# Altium project Board1.PrjPcb
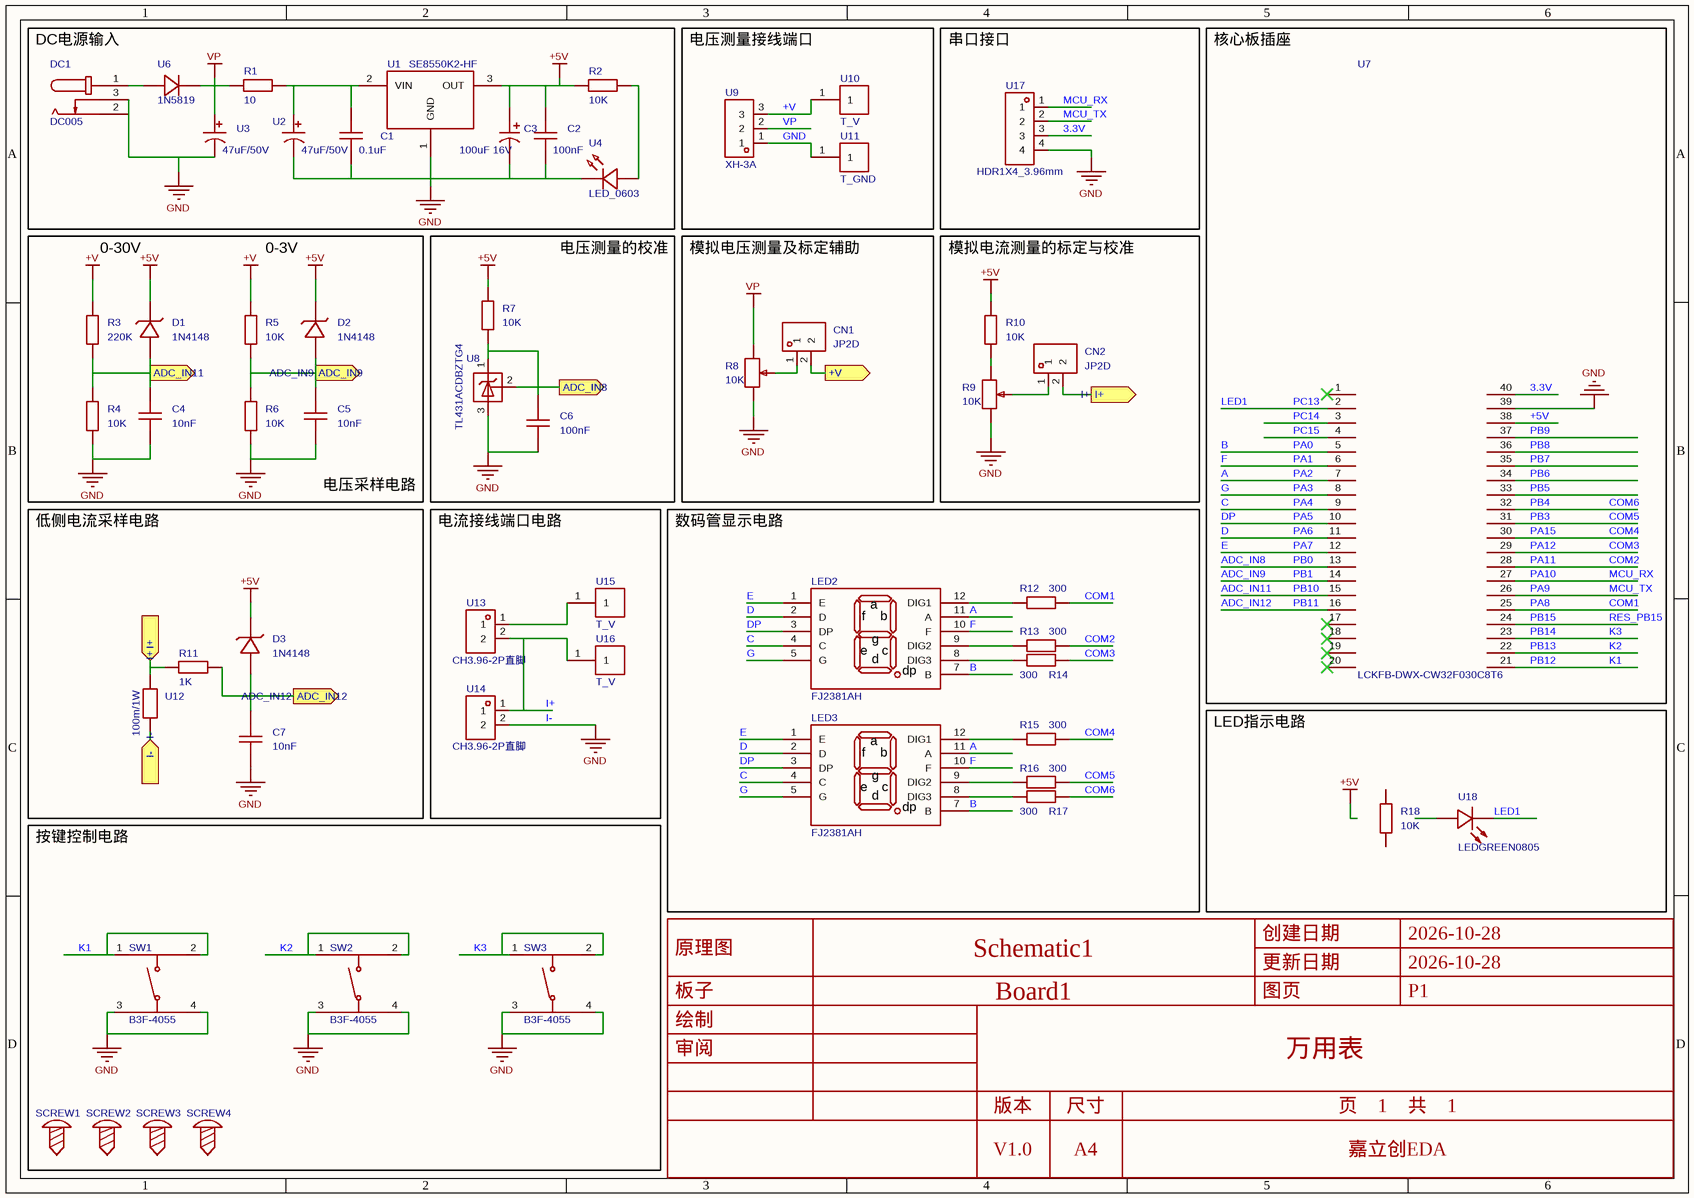
[diagram p0: P1.schdoc]
1 sheet, 57 parts. Net scope: flat (ports and power ports of the same name join across sheets).
Board file: PCB1.pcbdoc

## Sheet P1.schdoc
size 297 x 209 mm; Symbol: Drawing-Symbol_A4; Device: Drawing-Symbol_A4; Company: 嘉立创EDA; Version: V1.0; Page Size: A4; @Project Name: 万用表; @Update Date: 2026-10-28; @Create Date: 2026-10-28; @Board Name: Board1; @Page Name: P1; @Create Time: 20:47:09; @Page Count: 1; @Page No: 1; @Schematic Name: Schematic1; @Update Time: 20:47:09; @Assembly Variant: Basic; Border: 1; Title Block Position: 3; Size: A4; Width: 1170; Height: 825; Region Start: 1; X Region Count: 6; Y Region Count: 4; Blade Width: 10

### Parts
C1  0.1uF  [C0603]
C2  100nF  [C0603]
C3  100uF 16V  [CAP-SMD_L6.0-W3.2-FD]
C4  10nF  [C0603]
C5  10nF  [C0603]
C6  100nF  [C0603]
C7  10nF  [C0603]
CN1  JP2D  [CONN-TH_2P-P3.96-V]
CN2  JP2D  [CONN-TH_2P-P3.96-V]
D1  1N4148  [SOD-123_L2.7-W1.7-LS3.8-RD]
D2  1N4148  [SOD-123_L2.7-W1.7-LS3.8-RD]
D3  1N4148  [SOD-123_L2.7-W1.7-LS3.8-RD]
DC1  DC005  [DC-IN-TH_DC005]
LED2  FJ2381AH  [LED-SEG-TH_FJ2381AH]
LED3  FJ2381AH  [LED-SEG-TH_FJ2381AH]
R1  10  [R0603]
R2  10K  [R0603]
R3  220K  [R0603]
R4  10K  [R0603]
R5  10K  [R0603]
R6  10K  [R0603]
R7  10K  [R0603]
R8  10K  [RES-ADJ-TH_3296W]
R9  10K  [RES-ADJ-TH_3296W]
R10  10K  [R0603]
R11  1K  [R0603]
R12  300  [R0603]
R13  300  [R0603]
R14  300  [R0603]
R15  300  [R0603]
R16  300  [R0603]
R17  300  [R0603]
R18  10K  [R0603]
SCREW1  (no value)  [M2螺丝]
SCREW2  (no value)  [M2螺丝]
SCREW3  (no value)  [M2螺丝]
SCREW4  (no value)  [M2螺丝]
SW1  B3F-4055  [SW-TH_4P-L12.0-W12.0-P5.00-LS12.5]
SW2  B3F-4055  [SW-TH_4P-L12.0-W12.0-P5.00-LS12.5]
SW3  B3F-4055  [SW-TH_4P-L12.0-W12.0-P5.00-LS12.5]
U1  SE8550K2-HF  [SOT-89-3_L4.5-W2.5-P1.50-LS4.2-BR]
U2  47uF/50V  [CAP-TH_BD8.0-P3.50-D0.6-FD-2]
U3  47uF/50V  [CAP-TH_BD8.0-P3.50-D0.6-FD-2]
U4  LED_0603  [LED0603-RD_RED]
U6  1N5819  [SMA_L4.3-W2.6-LS5.1-RD]
U7  LCKFB-DWX-CW32F030C8T6  [DIP-40_L53.34-W15.24-P2.54-LS15.24]
U8  TL431ACDBZTG4  [SOT-23-3_L3.0-W1.7-P0.95-LS2.9-BR]
U9  XH-3A  [CONN-TH_3P-P2.50_C9900023074]
U10  T_V  [TH-1_C9900016725]
U11  T_GND  [TH-1_C9900016725]
U12  100m/1W  [R1206]
U13  CH3.96-2P直脚  [CONN-TH_CH3.96-2P]
U14  CH3.96-2P直脚  [CONN-TH_CH3.96-2P]
U15  T_V  [TH-1_C9900016725]
U16  T_V  [TH-1_C9900016725]
U17  HDR1X4_3.96mm  [CONN-TH_4P-P3.96_FWF39601-S04S22W1B]
U18  LEDGREEN0805  [LED0805-R-RD_GREEN]

### Blocks framed on the sheet
DC电源输入: C1-C3 DC1 R1 R2 U1-U4 U6
电压测量接线端口: U9-U11
串口接口: U17
核心板插座: U7
电压测量的校准: C6 R7 U8
模拟电压测量及标定辅助: CN1 R8
模拟电流测量的标定与校准: CN2 R9 R10
电流接线端口电路: U13-U16
数码管显示电路: LED2 LED3 R12-R17
LED指示电路: R18 U18
按键控制电路: SCREW1-SCREW4 SW1-SW3

### Ports
+V (out), ADC_IN8 (out), ADC_IN9 (out), ADC_IN11 (out), ADC_IN12 (out), I+ (in), I+ (out), I- (in)

### Nets
+5V: C2.2 C3.1 D1.1(K) D2.1(K) D3.1(K) R2.1 R7.2 R10.2 U1.3(OUT) U7.38
+V: R3.2 R5.2 U9.3 U10.1
GND: C1.1 C2.1 C3.2 C4.1 C5.1 C6.1 C7.1 DC1.2 DC1.3 R4.1 R6.1 R8.1 R9.1 SW1.3 SW1.4 SW2.3 SW2.4 SW3.3 SW3.4 U1.1(GND) U2.2 U3.2 U4.1(K) U7.39 U8.3(A) U9.1 U11.1 U12.2 U14.2 U17.4 ; port I-  [also labelled I-]
VP: R1.1 R8.3 U3.1 U6.1(K) U9.2
3.3V: U7.40 U17.3
A: LED2.11(A) LED3.11(A) U7.7  [also labelled PA2]
ADC_IN8: U7.13  [also labelled PB0]
ADC_IN9: C5.2 D2.2(A) R5.1 R6.2 U7.14 ; port ADC_IN9  [also labelled PB1]
ADC_IN11: U7.15  [also labelled PB10]
ADC_IN12: C7.2 D3.2(A) R11.1 U7.16 ; port ADC_IN12  [also labelled PB11]
B: LED2.7(B) LED3.7(B) U7.5  [also labelled PA0]
C: LED2.4(C) LED3.4(C) U7.9  [also labelled PA4]
COM1: R12.1 U7.25  [also labelled PA8]
COM2: R13.1 U7.28  [also labelled PA11]
COM3: R14.1 U7.29  [also labelled PA12]
COM4: R15.1 U7.30  [also labelled PA15]
COM5: R16.1 U7.31  [also labelled PB3]
COM6: R17.1 U7.32  [also labelled PB4]
D: LED2.2(D) LED3.2(D) U7.11  [also labelled PA6]
DP: LED2.3(DP) LED3.3(DP) U7.10  [also labelled PA5]
E: LED2.1(E) LED3.1(E) U7.12  [also labelled PA7]
F: LED2.10(F) LED3.10(F) U7.6  [also labelled PA1]
G: LED2.5(G) LED3.5(G) U7.8  [also labelled PA3]
I+: CN2.2 R11.2 U12.1 U13.2 U14.1 U16.1 ; port I+
K1: SW1.1 SW1.2 U7.21  [also labelled PB12]
K2: SW2.1 SW2.2 U7.22  [also labelled PB13]
K3: SW3.1 SW3.2 U7.23  [also labelled PB14]
LED1: U7.2 U18.2(K)  [also labelled PC13]
MCU_RX: U7.27 U17.1  [also labelled PA10]
MCU_TX: U7.26 U17.2  [also labelled PA9]
PB5: U7.33
PB6: U7.34
PB7: U7.35
PB8: U7.36
PB9: U7.37
PB15: U7.24  [also labelled RES_PB15]
PC14: U7.3
PC15: U7.4
NetC1_2: C1.2 R1.2 U1.2(VIN) U2.1
NetC4_2: C4.2 D1.2(A) R3.1 R4.2 ; port ADC_IN11
NetC6_2: C6.2 R7.1 U8.1(K) U8.2(R) ; port ADC_IN8
NetCN1_1: CN1.1 R8.2
NetCN1_2: CN1.2 ; port +V
NetCN2_1: CN2.1 R9.2
NetDC1_1: DC1.1 U6.2(A)
NetLED2_8: LED2.8(DIG3) R14.2
NetLED2_9: LED2.9(DIG2) R13.2
NetLED2_12: LED2.12(DIG1) R12.2
NetLED3_8: LED3.8(DIG3) R17.2
NetLED3_9: LED3.9(DIG2) R16.2
NetLED3_12: LED3.12(DIG1) R15.2
NetR2_2: R2.2 U4.2(A)
NetR9_3: R9.3 R10.1
NetU13_1: U13.1 U15.1

Not connected (* = marked no-connect by the designer): R18 1 2; SCREW1 1; SCREW2 1; SCREW3 1; SCREW4 1; U7 1(0)* 17(0)* 18(0)* 19(0)* 20(0)*; U18 1(A)

### Notes on the sheet
- 0-30V
- 0-3V
- (near C5) 电压采样电路
- 低侧电流采样电路
- 创建日期
- 2026-10-28
- 原理图
- 板子
- Schematic1
- Board1
- 更新日期
- 图页
- P1
- 绘制
- 审阅
- 万用表
- 版本
- V1.0
- 尺寸
- A4
- 页    1    共    1
- 嘉立创EDA
- (in symbol FJ2381AH) a; f; b; g; e; c; d; dp

### Library data of the parts
C1 C2 = CAP_0603: Symbol: Capacitance; ConvertToPcb: yes; ModelId: ac125912035d415993ca9572d50418b10819f05c4eef4c71ace90d822a990e87; ModelName: C0603_L1.6-W0.8-H0.8; ModelTransform: 62.992,31.496,0,0,0,0,0,0,0; Device: CAP_0603; FootprintName: C0603; AddInBom: yes; Supplier Footprint: 0603
  C1: Value: 0.1uF
  C2: Value: 100nF
C3 = 100uF 16V: AddInBom: yes; ModelId: f3109eabdf8740af9f36b97adf252a880819f05c4eef4c71ace90d822a990e87; ModelName: CAP-SMD_L6.0-W3.2-RD; ModelTransform: 237.7948,125.984,0,0,0,0,0,0,0; Symbol: 100UF 16V; Device: 100uF 16V; FootprintName: CAP-SMD_L6.0-W3.2-FD; LCSC Part Name: 100uF 16V; SupplierPart: C9900019364; ManufacturerPart: 100uF 16V; Supplier Footprint: CAP-SMD_6032; JLCPCB Part Class: Extended Part; Supplier: LCSC; ConvertToPcb: yes
C4-C7 = CAP_0603: Symbol: Capacitance; 3D Model: ac125912035d415993ca9572d50418b10819f05c4eef4c71ace90d822a990e87; 3D Model Transform: 62.992,31.496,0,0,0,0,0,0,0; ConvertToPcb: yes; ModelName: C0603_L1.6-W0.8-H0.8; Device: CAP_0603; Supplier Footprint: 0603; FootprintName: C0603; AddInBom: yes
  C4 C5 C7: Value: 10nF
  C6: Value: 100nF
CN1 CN2 = JP2D: AddInBom: yes; ModelId: 2eb2d044c10a453aa78fdaaf8421e3e00819f05c4eef4c71ace90d822a990e87; ModelTransform: 311.8104,334.645,0,0,0,0,0,-23.622,-149.606; Symbol: JP2D; Device: JP2D; FootprintName: CONN-TH_2P-P3.96-V; LCSC Part Name: JP2D; SupplierPart: C9900014930; ManufacturerPart: JP2D; Supplier Footprint: VH3.96; JLCPCB Part Class: Extended Part; Supplier: LCSC; ConvertToPcb: yes; ModelName: CONN-TH_2P-P3.96-V
D1-D3 = 1N4148: Symbol: 1N4148_C9900009645; AddInBom: yes; ModelId: b455d3bf1dad47d3a75f9a76b08071c60819f05c4eef4c71ace90d822a990e87; ModelTransform: 145.669,64.961,0,0,0,0,0,0,0; Device: 1N4148; FootprintName: SOD-123_L2.7-W1.7-LS3.8-RD; LCSC Part Name: 1N4148; SupplierPart: C9900009645; ManufacturerPart: 1N4148; Supplier Footprint: SOD-123_L2.7-W1.7--LS3.8-RD; JLCPCB Part Class: Extended Part; Supplier: LCSC; ConvertToPcb: yes; ModelName: SOD-123_L2.7-W1.7-LS3.8-RD
DC1 = DC005: 连接器类型:DC电源插座;安装方式:弯插;触点内径:2mm;触点外径:6.3mm;额定电流:500mA;额定电压:12V;工作温度:-30℃~+70℃;; Manufacturer: SHOU HAN(首韩); Symbol: DC005_C431533; AddInBom: yes; ModelId: f168fe383f964e0ea2af0127ff6ac7b40819f05c4eef4c71ace90d822a990e87; ModelTransform: 366.141,553.149,0,270,0,0,-141.734,88.583,-149.606; Connector Type: DC电源插座; Inside Contact Diameter: 2mm; Outside Contact Diameter: 6.3mm; Current Rating: 500mA; Voltage Rating (Max): 12V; Body Height: 10.9mm; Device: DC005; FootprintName: DC-IN-TH_DC005; LCSC Part Name: DC电源插座 内径:2mm 外径:6.3mm; SupplierPart: C431533; ManufacturerPart: DC005; Supplier Footprint: 插件; JLCPCB Part Class: Extended Part; Datasheet: https://item.szlcsc.com/datasheet/DC005/427890.html; Supplier: LCSC; ConvertToPcb: yes; ModelName: DC-IN-TH_DC005; Mounting Type: 弯插; Length: 13.6mm; Width: 8.9mm; Operating Temperature: -30℃~+70℃
LED2 LED3 = FJ2381AH: 数码管位数:3位;字符尺寸(英寸):0.28;LED极性:共阴;发光颜色:红色;耗散功率(Pd):-;; Manufacturer: 志浩; AddInBom: yes; ModelId: b22df6d78d6c4251bddd51b739e5becf0819f05c4eef4c71ace90d822a990e87; ModelName: LED-SEG-TH_11P-L22.5-W10.0-H6.1-P2.54-S7.62; ModelTransform: 885.825,393.7,0,0,0,0,0,0,-137.795; Number of Characters: 3位; Digit/Alpha Size(inch): 0.28; Display Type: 7段; LED Polarity: 共阴; Illumination Color: 红色; Symbol: FJ2381AH; Device: FJ2381AH; FootprintName: LED-SEG-TH_FJ2381AH; LCSC Part Name: 3位0.28英寸红色数码管 共阴极; SupplierPart: C10701; ManufacturerPart: FJ2381AH; Supplier Footprint: 插件; JLCPCB Part Class: Extended Part; Datasheet: https://item.szlcsc.com/datasheet/FJ2381AH/11245.html; Supplier: LCSC; ConvertToPcb: yes; Light Intensity: -; Forward Voltage Drop: -; Pd - Power Dissipation: -; Operating Temperature: -; Length: 22.53mm; Width: 10mm; Height: 6.1mm
R1 R2 = Res_0603: Symbol: 电阻; ConvertToPcb: yes; ModelId: fc143cca1e79419f9cd78b61e9279f080819f05c4eef4c71ace90d822a990e87; ModelTransform: 31.8897,63.7794,0,90,0,0,0,0,0; Device: Res_0603; FootprintName: R0603; AddInBom: yes; Supplier Footprint: 0603; ModelName: R0603
  R1: Value: 10
  R2: Value: 10K
R3-R7 R10-R18 = Res_0603: Symbol: 电阻; 3D Model: fc143cca1e79419f9cd78b61e9279f080819f05c4eef4c71ace90d822a990e87; 3D Model Transform: 31.8897,63.7794,0,90,0,0,0,0,0; ConvertToPcb: yes; Device: Res_0603; Supplier Footprint: 0603; FootprintName: R0603; AddInBom: yes; ModelName: R0603
  R3: Value: 220K
  R4-R7 R10 R18: Value: 10K
  R11: Value: 1K
  R12-R17: Value: 300
R8 R9 = 精密电位器 3296W/50欧姆: 阻值:-;功率:-;; Symbol: Precision potentiometer 3296W/50ohm; AddInBom: yes; ModelId: 3664f7b541aa4725a8b6d3b7a961f0780819f05c4eef4c71ace90d822a990e87; ModelTransform: 374.015,188.976,0,90,0,0,2.362,0.005,-137.795; Device: 精密电位器 3296W/50欧姆; Value: 10K; FootprintName: RES-ADJ-TH_3296W; LCSC Part Name: 50Ω; ManufacturerPart: 精密电位器 3296W/50欧姆; Supplier Footprint: VR-3296W; JLCPCB Part Class: Extended Part; Supplier: LCSC; ConvertToPcb: yes; ModelName: RES-ADJ-TH_3296W; Rated Voltage: -; Power(Watts): -; Turns: -
SCREW1-SCREW4 = M2螺丝: Symbol: 螺丝孔; ConvertToPcb: yes; Device: M2螺丝; FootprintName: M2螺丝; AddInBom: yes; Supplier Footprint: 插件
SW1-SW3 = B3F-4055: Symbol: B3F-4055_C9900023790; AddInBom: yes; ModelId: 7313330cfbcf439981db3a700e07703f0819f05c4eef4c71ace90d822a990e87; ModelTransform: 542.968,472.47937,0,0,0,0,0,0.005,-137.795; Device: B3F-4055; FootprintName: SW-TH_4P-L12.0-W12.0-P5.00-LS12.5; LCSC Part Name: B3F-4055; SupplierPart: C9900023790; ManufacturerPart: B3F-4055; Supplier Footprint: B3F-4055轻触开关4脚按键12*12*6; JLCPCB Part Class: Extended Part; Supplier: LCSC; ConvertToPcb: yes; ModelName: SW-TH_4P-L12.0-W12.0-P5.00-LS12.5
U1 = SE8550K2-HF: 输出极性:正极;工作电压:35V;输出电压:5V;输出电流:200mA;电源纹波抑制比(PSRR):80dB;输出类型:固定;; Manufacturer: SEAWARD(思旺); Symbol: SE8550-HF; AddInBom: yes; ModelId: 6db690b7897d4d18a30d90c1b89525ee0819f05c4eef4c71ace90d822a990e87; ModelName: SOT-89-3_L4.3-W2.5-H1.6-LS4.1-P1.50; ModelTransform: 161.417,169.291,0,180,0,0,-18.661,0,0; Output Configuration: 正极; Voltage - Supply: 35V; Output Voltage: 5V; Output Current: 200mA; Power Supply Rejection Ratio (PSRR): 80dB; Voltage Dropout: 300mV@(100mA); standby current: 2.5uA; Output Type: 固定; Device: SE8550K2-HF; FootprintName: SOT-89-3_L4.5-W2.5-P1.50-LS4.2-BR; LCSC Part Name: 5V 200mA 35V; SupplierPart: C115012; ManufacturerPart: SE8550K2-HF; Supplier Footprint: SOT-89-3; JLCPCB Part Class: Extended Part; Datasheet: https://item.szlcsc.com/datasheet/SE8550K2-HF/116256.html; Supplier: LCSC; ConvertToPcb: yes; Noise: -; Features: 输入欠压保护；使能控制；短路保护；热关断; Operating Temperature: -20℃~+85℃; Number of Outputs: -
U2 U3 = 电解电容100uF/50V: AddInBom: yes; ModelId: fd7be3432f664311809e69e3b3557c130819f05c4eef4c71ace90d822a990e87; ModelTransform: 314.96,315.3537,0,90,0,0,0,0,-196.85; Symbol: 电解电容100UF/50V; Device: 电解电容100uF/50V; Manufacturer Part: 47uF/50V; FootprintName: CAP-TH_BD8.0-P3.50-D0.6-FD-2; LCSC Part Name: 电解电容100uF/50V; SupplierPart: C9900023275; Supplier Footprint: CAP-TH_BD8.0-P3.50; JLCPCB Part Class: Extended Part; Supplier: LCSC; ConvertToPcb: yes; ModelName: CAP-TH_BD8.0-P3.50-D0.6-FD-2
U4 = LED_0603: AddInBom: yes; ModelId: 74041d3a270d435c8600a9ab9b7641c00819f05c4eef4c71ace90d822a990e87; ModelTransform: 63.7794,31.496,0,0,0,0,0,-0.002,0; Symbol: LED_0603; Device: LED_0603; FootprintName: LED0603-RD_RED; LCSC Part Name: LED_0603; SupplierPart: C9900015761; ManufacturerPart: LED_0603; Supplier Footprint: LEDRED; JLCPCB Part Class: Extended Part; Supplier: LCSC; ConvertToPcb: yes; ModelName: LED0603-RD_RED
U6 = 1N5819: Symbol: 1N5819_C9900008009; AddInBom: yes; ModelId: 1d20a911e9694ba6aaf6e9207164e4da0819f05c4eef4c71ace90d822a990e87; ModelTransform: 196.4563,102.362,0,0,0,0,0.001,-0.001,0; Device: 1N5819; FootprintName: SMA_L4.3-W2.6-LS5.1-RD; LCSC Part Name: 1N5819; SupplierPart: C9900008009; ManufacturerPart: 1N5819; Supplier Footprint: SMA_L4.3-W2.6-LS5.1-RD; JLCPCB Part Class: Extended Part; Supplier: LCSC; ConvertToPcb: yes; ModelName: SMA_L4.3-W2.6-LS5.1-RD
U7 = LCKFB-DWX-CW32F030C8T6: 搭载Cortex-M0+内核,程序存储容量64KB,RAM总容量8KB,最高64MHz主频,提供高效的计算能力和稳定的运行环境。; Manufacturer: 立创开发板; AddInBom: yes; ModelId: 65c6a085ee334f57b7e20e20cdb6a0820819f05c4eef4c71ace90d822a990e87; ModelTransform: 2114.856,898.9982,0,90,0,0,0,-7.874,-236.22; Symbol: LCKFB-DWX-CW32F030C8T6; Device: LCKFB-DWX-CW32F030C8T6; FootprintName: DIP-40_L53.34-W15.24-P2.54-LS15.24; LCSC Part Name: 立创·地文星-CW32F030C8T6开发板; SupplierPart: C22751548; ManufacturerPart: LCKFB-DWX-CW32F030C8T6; Supplier Footprint: -; JLCPCB Part Class: Extended Part; Datasheet: https://item.szlcsc.com/datasheet/LCKFB-DWX-CW32F030C8T6/24478332.html; Supplier: LCSC; ConvertToPcb: yes; ModelName: DIP-40_L53.34-W15.24-P2.54-LS15.24
U8 = TL431ACDBZTG4: 输出类型:可调;输入电压:-;输出电流:100mA;精度:±1%;; Manufacturer: TI(德州仪器); AddInBom: yes; ModelId: 89cb27a44ab2466697082bb9fd73a7d00819f05c4eef4c71ace90d822a990e87; ModelName: SOT-23-3L_L2.9-W1.6-H1.1-LS2.8-P0.95; ModelTransform: 114.173,110.236,0,90,0,0,0,0,0; Output Type: 可调; Output Current: 100mA; Tolerance: ±1%; Reference Type: 并联; Symbol: TL431ACDBZTG4; Device: TL431ACDBZTG4; FootprintName: SOT-23-3_L3.0-W1.7-P0.95-LS2.9-BR; LCSC Part Name: TL431ACDBZTG4; SupplierPart: C2157219; ManufacturerPart: TL431ACDBZTG4; Supplier Footprint: SOT-23; JLCPCB Part Class: Extended Part; Datasheet: https://www.ti.com/cn/lit/gpn/tl431; Supplier: LCSC; ConvertToPcb: yes; Input Voltage: -; Temperature Coefficient: -; Supply Current: -; Noise - 1/10Hz to 10Hz: -; Noise - 10Hz to 10kHz: -; Operating Temperature: 0℃~+70℃@(Ta)
U9 = XH-3A_C9900023074: AddInBom: yes; ModelId: f64135b5aae74472b0d9f88aaedb98e80819f05c4eef4c71ace90d822a990e87; ModelTransform: 394.094,224.409,0,0,0,0,0,18.661,-118.11; Symbol: XH-3A_C9900023074; Device: XH-3A_C9900023074; FootprintName: CONN-TH_3P-P2.50_C9900023074; LCSC Part Name: XH-3A; SupplierPart: C9900023074; ManufacturerPart: XH-3A; Supplier Footprint: XH2.54-3P; JLCPCB Part Class: Extended Part; Supplier: LCSC; ConvertToPcb: yes; ModelName: CONN-TH_3P-P2.50_C9900023074
U10 U11 U15 U16 = NEW_FOOTPRINT: AddInBom: yes; ModelId: de06a563d2fa4cfb9506e2ac83ef3f720819f05c4eef4c71ace90d822a990e87; ModelTransform: 216.35,236.22004,0,0,0,0,0,-33.465,-98.425; Symbol: NEW_FOOTPRINT; Device: NEW_FOOTPRINT; FootprintName: TH-1_C9900016725; LCSC Part Name: NEW_FOOTPRINT; SupplierPart: C9900016725; Supplier Footprint: NEW_FOOTPRINT; JLCPCB Part Class: Extended Part; Supplier: LCSC; ConvertToPcb: yes; ModelName: TH-1_C9900016725
  U10 U15 U16: Manufacturer Part: T_V
  U11: Manufacturer Part: T_GND
U12 = ARG06BTC2151: AddInBom: yes; ModelId: 89a1f13db2384da588040e0b3c55bf660819f05c4eef4c71ace90d822a990e87; ModelName: R1206_L3.2-W1.6-H0.6; ModelTransform: 125.984,62.992,0,0,0,0,0,0,0; Symbol: ARG06BTC2151; Device: ARG06BTC2151; Manufacturer Part: 100m/1W; FootprintName: R1206; LCSC Part Name: ARG06BTC2151; SupplierPart: C9900151771; Supplier Footprint: R1206; JLCPCB Part Class: Extended Part; Supplier: LCSC; ConvertToPcb: yes
U13 U14 = CH3.96-2P直脚: AddInBom: yes; ModelId: df1c1c596aa749818eee4fbdc34283bf0819f05c4eef4c71ace90d822a990e87; ModelTransform: 314.96,437.401,0,0,0,0,0,0,-137.795; Symbol: CH3.96-2P直脚; Device: CH3.96-2P直脚; FootprintName: CONN-TH_CH3.96-2P; LCSC Part Name: CH3.96-2P直脚; SupplierPart: C9900013003; ManufacturerPart: CH3.96-2P直脚; Supplier Footprint: CON2; JLCPCB Part Class: Extended Part; Supplier: LCSC; ConvertToPcb: yes; ModelName: CONN-TH_CH3.96-2P
U17 = HDR1X4_3.96mm: AddInBom: yes; ModelId: d1971f11994642cab35ac1c5dad2b2580819f05c4eef4c71ace90d822a990e87; ModelTransform: 623.6208,325.1962,0,0,0,0,-0.001,-26.378,-137.795; Symbol: HDR1X4_3.96MM; Device: HDR1X4_3.96mm; FootprintName: CONN-TH_4P-P3.96_FWF39601-S04S22W1B; LCSC Part Name: HDR1X4_3.96mm; SupplierPart: C9900002236; ManufacturerPart: HDR1X4_3.96mm; Supplier Footprint: TH-4_8.2X15.84X3.96P; JLCPCB Part Class: Extended Part; Supplier: LCSC; ConvertToPcb: yes; ModelName: CONN-TH_4P-P3.96_FWF39601-S04S22W1B
U18 = LEDGREEN0805: AddInBom: yes; ModelId: 8baff3af93dc43f9ae0855f3d9d6093c0819f05c4eef4c71ace90d822a990e87; ModelTransform: 78.74,49.209,0,0,0,0,0,0,0; Symbol: LEDGREEN0805; Device: LEDGREEN0805; FootprintName: LED0805-R-RD_GREEN; LCSC Part Name: LEDGREEN0805; SupplierPart: C9900013047; ManufacturerPart: LEDGREEN0805; Supplier Footprint: LED0805-R-RD; JLCPCB Part Class: Extended Part; Supplier: LCSC; ConvertToPcb: yes; ModelName: LED0805-R-RD_GREEN